# Altium schematic sheet MCU.SchDoc: ESP32 - ANALOG BOARD
size A3; Author: Luca Schenetti; DrawnBy: Luca Schenetti; Engineer: Luca Schenetti; Revision: B; SheetNumber: 2; SheetTotal: 5
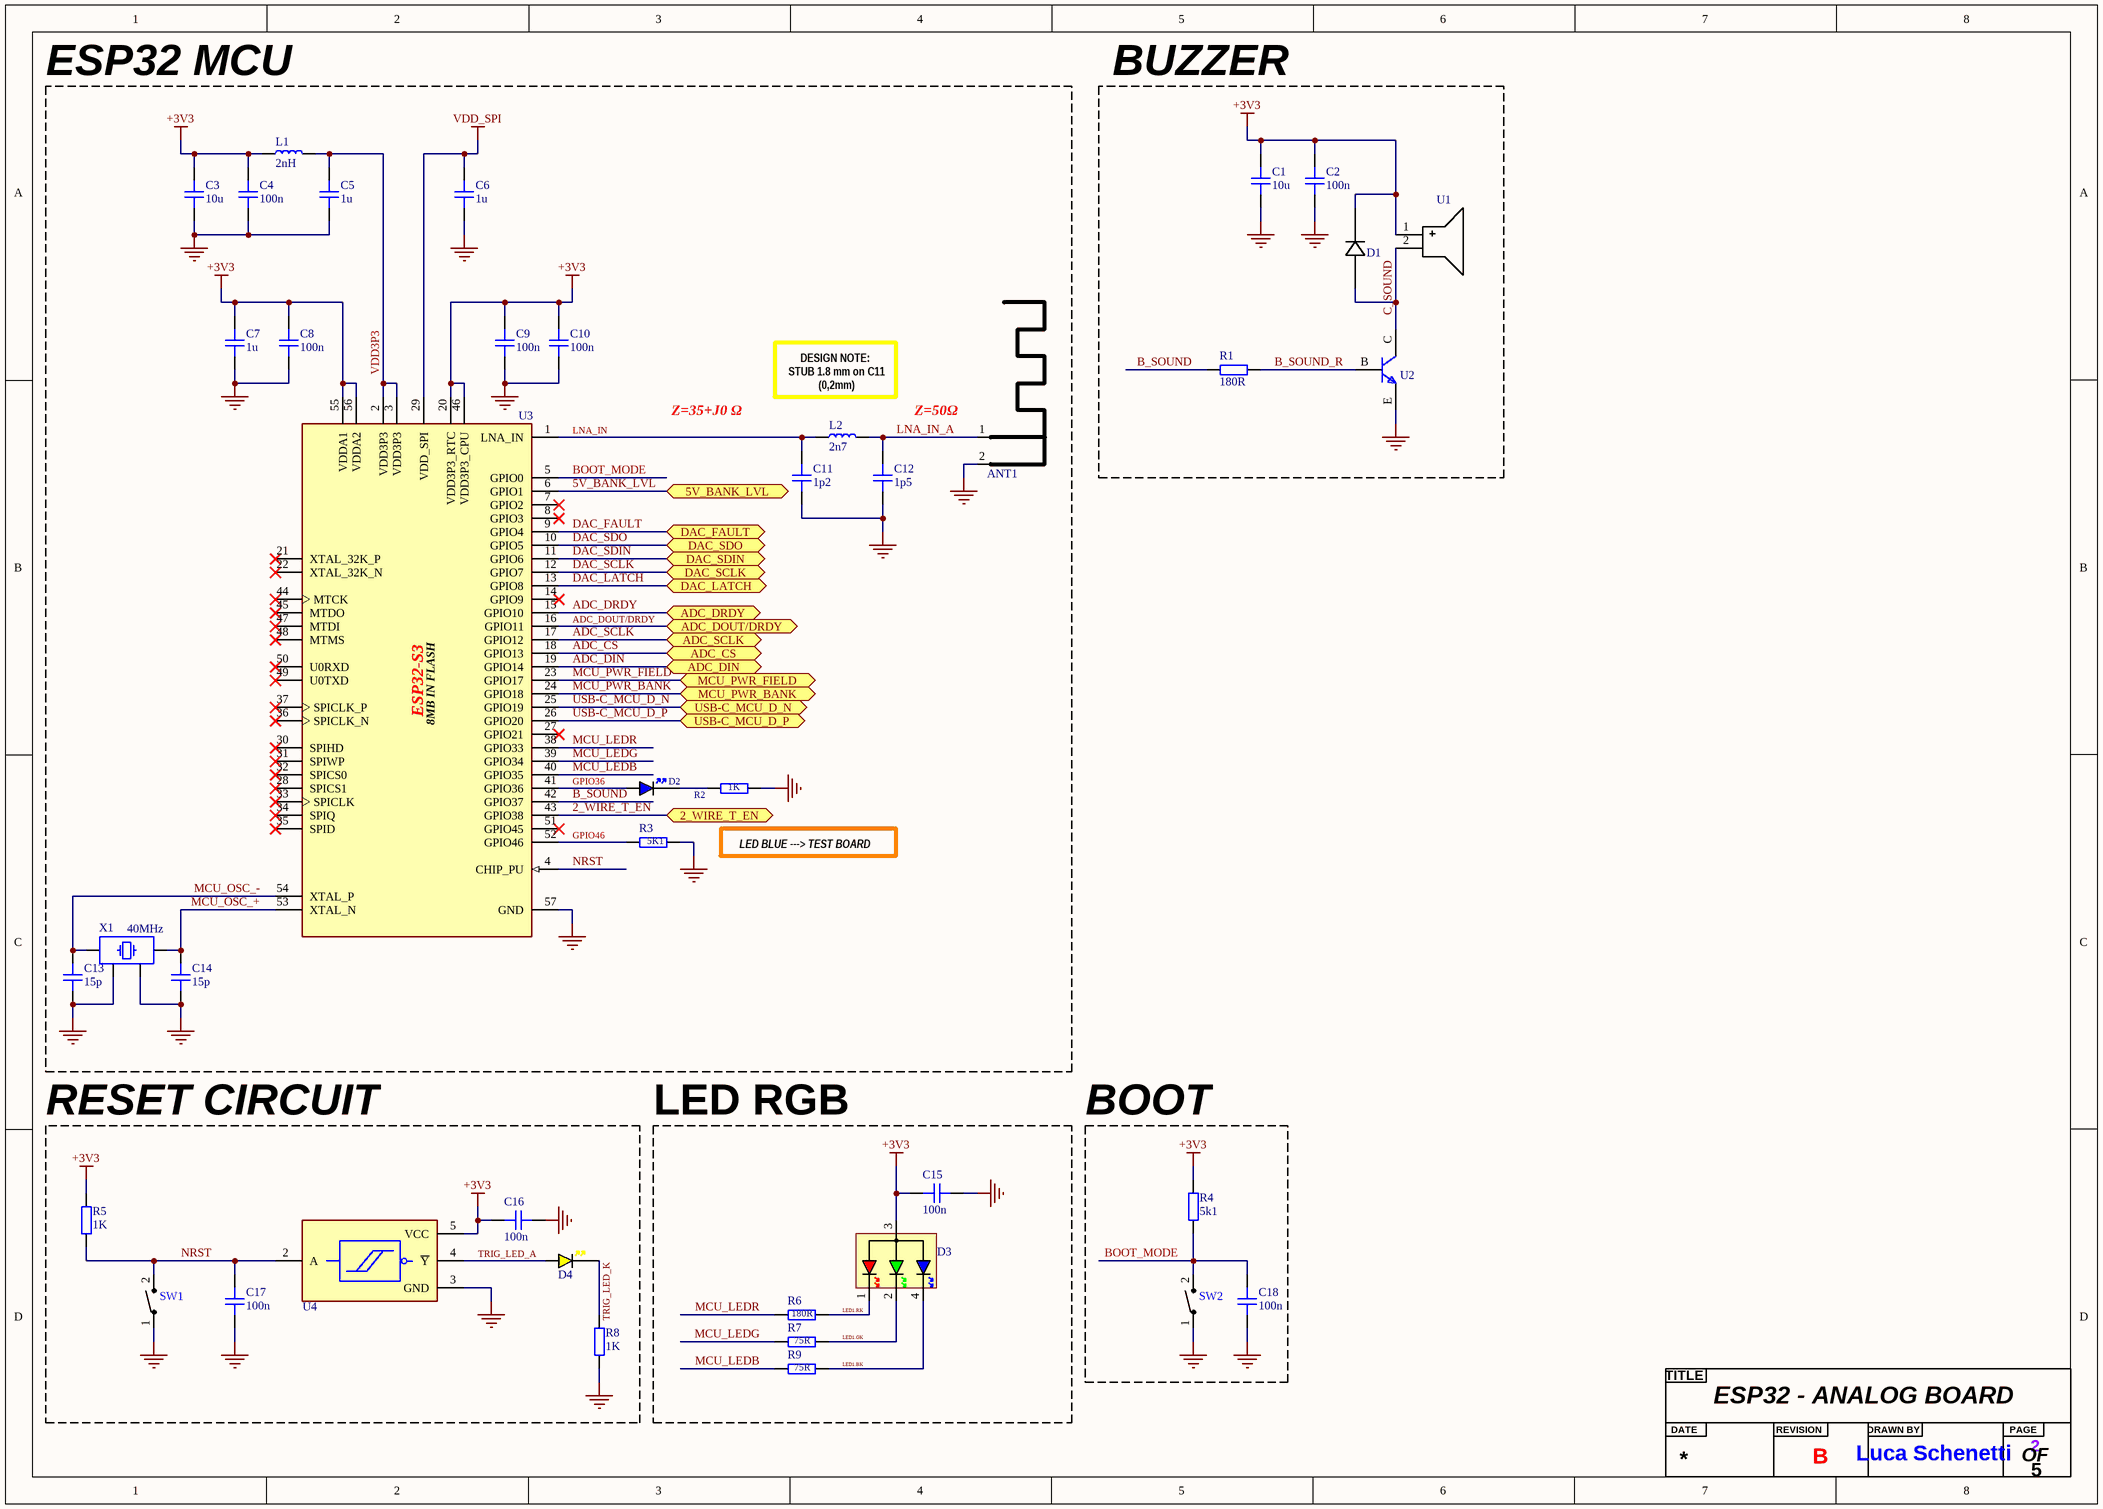
[diagram p0: MCU.SchDoc]

## Parts
?  Title  (value not drawn)  (graphical)
ANT1  PCB Antenna 2.4GHz 50Ohm  [ANT_IFA_USB_2_4GHZ_50R]  (value not drawn)  (no BOM)
C1  10u  [CAP_0402]
C2  100n  [CAP_0402]
C3  10u  [CAP_0402]
C4  100n  [CAP_0402]
C5  1u  [CAP_0402]
C6  1u  [CAP_0402]
C7  1u  [CAP_0402]
C8  100n  [CAP_0402]
C9  100n  [CAP_0402]
C10  100n  [CAP_0402]
C11  1p2  [CAP_0402]
C12  1p5  [CAP_0402]
C13  15p  [CAP_0402]
C14  15p  [CAP_0402]
C15  100n  [CAP_0402]
C16  100n  [CAP_0402]
C17  100n  [CAP_0402]
C18  100n  [CAP_0402]
D1  DIODE 300mA 75V  [1N4148W]  (value not drawn)
D2  BLUE  [LED_0603_BLUE]  (value not drawn)
D3  RGB_LED  [XL-2012RGBC]  (value not drawn)
D4  YELLOW  [LED_0603_YELLOW]  (value not drawn)
L1  2nH  [IND_0402]
L2  2n7  [IND_0402]
R1  180R  [RES_0402]
R2  1K  [RES_0402]
R3  5K1  [RES_0402]
R4  5k1  [RES_0402]
R5  1K  [RES_0402]
R6  180R  [RES_0402]
R7  75R  [RES_0402]
R8  1K  [RES_0402]
R9  75R  [RES_0402]
SW1  TS-1088-AR02016  [TS-1088-AR02016]  (value not drawn)
SW2  TS-1088-AR02016  [TS-1088-AR02016]  (value not drawn)
U1  Passive Buzzer 4kHz  [KLJ-4020]  (value not drawn)
U2  TRANSISTOR NPN  [SS8050]  (value not drawn)
U3  ESP32-S3 8MB IN FLASH  [ESP32-S3FN8]  (value not drawn)
U4  Schmitt Trigger 1.65V~5.5V  [74LVC1G14GW,125]  (value not drawn)
X1  40MHz  [XTAL_3225]

## Blocks framed on the sheet
ESP32 MCU: ANT1 C3-C14 D2 L1 L2 R2 R3 U3 X1
BUZZER: C1 C2 D1 R1 U1 U2
RESET CIRCUIT: C16 C17 D4 R5 R8 SW1 U4
LED RGB: C15 D3 R6 R7 R9
BOOT: C18 R4 SW2

## Ports
2_WIRE_T_EN (bidir, see DAC[6B]), 5V_BANK_LVL (bidir, see PWR RAIL[4C]), ADC_CS (bidir, see ADC[5B]), ADC_DIN (bidir, see ADC[5B]), ADC_DOUT/DRDY (bidir, see ADC[5C]), ADC_DRDY (bidir, see ADC[5C]), ADC_SCLK (bidir, see ADC[5B]), DAC_FAULT (bidir, see DAC[6C]), DAC_LATCH (bidir, see DAC[6B]), DAC_SCLK (bidir, see DAC[6B]), DAC_SDIN (bidir, see DAC[6B]), DAC_SDO (bidir, see DAC[6C]), MCU_PWR_BANK (bidir, see PWR RAIL[6B]), MCU_PWR_FIELD (bidir, see PWR RAIL[6B]), USB-C_MCU_D_N (bidir, see PWR RAIL[3C]), USB-C_MCU_D_P (bidir, see PWR RAIL[3C])

## Nets
+3V3: C1.2 C2.2 C3.2 C4.2 C7.2 C8.2 C9.2 C10.2 C15.2 C16.2 D1.1(C) D3.3(AC) L1.1 R4.2 R5.2 U1.1(+) U3.20(VDD3P3_RTC) U3.46(VDD3P3_CPU) U3.55(VDDA1) U3.56(VDDA2) U4.5(VCC)
GND: ANT1.2(GND) C1.1 C2.1 C3.1 C4.1 C5.1 C6.1 C7.1 C8.1 C9.1 C10.1 C11.1 C12.1 C13.1 C14.1 C15.1 C16.1 C17.1 C18.1 R2.1 R3.1 R8.1 SW1.1 SW2.1 U2.E U3.57(GND) U4.3(GND) X1.2 X1.4
VDD_SPI: C6.2 U3.29(VDD_SPI)
2_WIRE_T_EN: U3.43(GPIO38) ; port 2_WIRE_T_EN
5V_BANK_LVL: U3.6(GPIO1) ; port 5V_BANK_LVL
ADC_CS: U3.18(GPIO13) ; port ADC_CS
ADC_DIN: U3.19(GPIO14) ; port ADC_DIN
ADC_DOUT/DRDY: U3.16(GPIO11) ; port ADC_DOUT/DRDY
ADC_DRDY: U3.15(GPIO10) ; port ADC_DRDY
ADC_SCLK: U3.17(GPIO12) ; port ADC_SCLK
B_SOUND: R1.1 U3.42(GPIO37)
B_SOUND_R: R1.2 U2.B
BOOT_MODE: C18.2 R4.1 SW2.2 U3.5(GPIO0)
C_SOUND: D1.2(A) U1.2(-) U2.C
DAC_FAULT: U3.9(GPIO4) ; port DAC_FAULT
DAC_LATCH: U3.13(GPIO8) ; port DAC_LATCH
DAC_SCLK: U3.12(GPIO7) ; port DAC_SCLK
DAC_SDIN: U3.11(GPIO6) ; port DAC_SDIN
DAC_SDO: U3.10(GPIO5) ; port DAC_SDO
GPIO36: D2.A U3.41(GPIO36)
GPIO46: R3.2 U3.52(GPIO46)
LED1.BK: D3.4(CB) R9.2
LED1.GK: D3.2(CG) R7.2
LED1.RK: D3.1(CR) R6.2
LNA_IN: C11.2 L2.1 U3.1(LNA_IN)
LNA_IN_A: ANT1.1(RF) C12.2 L2.2
MCU_LEDB: R9.1 U3.40(GPIO35)
MCU_LEDG: R7.1 U3.39(GPIO34)
MCU_LEDR: R6.1 U3.38(GPIO33)
MCU_OSC_+: C14.2 U3.53(XTAL_N) X1.1
MCU_OSC_-: C13.2 U3.54(XTAL_P) X1.3
MCU_PWR_BANK: U3.24(GPIO18) ; port MCU_PWR_BANK
MCU_PWR_FIELD: U3.23(GPIO17) ; port MCU_PWR_FIELD
NRST: C17.2 R5.1 SW1.2 U3.4(CHIP_PU) U4.2(A)
TRIG_LED_A: D4.A U4.4(~{Y})
TRIG_LED_K: D4.K R8.2
USB-C_MCU_D_N: U3.25(GPIO19) ; port USB-C_MCU_D_N
USB-C_MCU_D_P: U3.26(GPIO20) ; port USB-C_MCU_D_P
VDD3P3: C5.2 L1.2 U3.2(VDD3P3) U3.3(VDD3P3)
NetD2_K: D2.K R2.2

Not connected (* = marked no-connect by the designer): U3 7(GPIO2)* 8(GPIO3)* 14(GPIO9)* 21(XTAL_32K_P)* 22(XTAL_32K_N)* 27(GPIO21)* 28(SPICS1)* 30(SPIHD)* 31(SPIWP)* 32(SPICS0)* 33(SPICLK)* 34(SPIQ)* 35(SPID)* 36(SPICLK_N)* 37(SPICLK_P)* 44(MTCK)* 45(MTDO)* 47(MTDI)* 48(MTMS)* 49(U0TXD)* 50(U0RXD)* 51(GPIO45)*

## Notes on the sheet
- Z=35+J0 Ω
- (near L2) DESIGN NOTE:
  STUB 1.8 mm on C11
  (0,2mm)
- Z=50Ω
- LED BLUE ---> TEST BOARD
- (in symbol ESP32-S3FN8) ESP32-S3; 8MB IN FLASH
- (in symbol Title) TITLE; DATE; REVISION; DRAWN BY; PAGE; OF

## Library data of the parts
ANT1 = ANT_IFA_USB_2_4GHZ_50R: Inverted F 2.4GHz ISM PCB Antenna 50 Ohm; ComponentLink1Description: Datasheet; ComponentLink1URL: https://www.ti.com/lit/an/swra117d/swra117d.pdf
C1 C3 = CAP_0402: [C15525]; Manufacturer: *; Manufacturer Part Number: *; Distributor Link: *; LCSC: *; Rating: *; Dielectric: *
C2 C4 C8-C10 C15-C18 = CAP_0402: [C307331]; Manufacturer: *; Manufacturer Part Number: *; Distributor Link: *; LCSC: *; Rating: *; Dielectric: *
C5-C7 = CAP_0402: [C52923]; Manufacturer: *; Manufacturer Part Number: *; Distributor Link: *; LCSC: *; Rating: *; Dielectric: *
C11 = CAP_0402: [C76899]; Manufacturer: *; Manufacturer Part Number: *; Distributor Link: *; LCSC: *; Rating: *; Dielectric: *
C12 = CAP_0402: [C76900]; Manufacturer: *; Manufacturer Part Number: *; Distributor Link: *; LCSC: *; Rating: *; Dielectric: *
C13 C14 = CAP_0402: Capacitor SMD 0402 [C1548]; Manufacturer: *; Manufacturer Part Number: *; Distributor Link: *; LCSC: *; Rating: *; Dielectric: *
D1 = 1N4148W: [C917030]
D2 = LED_0603_BLUE: [C965807]
D3 = RGB_LED_0805: [C965848]
D4 = LED_0603_YELLOW: [C89811]
L1 = IND_0402: [C18216]
L2 = IND_0402: [C77108]
R1 R6 = RES_0402: [C138045]; Manufacturer: *; Manufacturer Part Number: *; Distributor Link: *; LCSC: *
R2 R5 R8 = RES_0402: [C11702]; Manufacturer: *; Manufacturer Part Number: *; Distributor Link: *; LCSC: *
R3 R4 = RES_0402: [C25905]; Manufacturer: *; Manufacturer Part Number: *; Distributor Link: *; LCSC: *
R7 R9 = RES_0402: [C25133]; Manufacturer: *; Manufacturer Part Number: *; Distributor Link: *; LCSC: *
SW1 SW2 = TS-1088-AR02016: [C720477]; Manufacturer: XUNPU(讯普); Add into BOM: yes; Circuit: SPST; Actuator Style: Round Button; Operating Force: 160gf; Switch Length: 4mm; Switch Width: 3mm; Switch Height: 2mm; Strike Gundam: 不带; Contact Current: 50mA; Voltage Rating (DC): 12V; Insulation Resistance: 100MΩ; Actuator/Cap Color: Black; Pin Style: SMDSplicing; Mechanical Life: 10万次; Symbol: TS-1088-AR02016; Device: TS-1088-AR02016; Supplier: LCSC; Supplier Part: C720477; Manufacturer Part: TS-1088-AR02016; JLCPCB Part Class: Extended Part; LCSC Part Name: 4*3*2mm 立贴 轻触开关; Supplier Footprint: SMD; Datasheet: https://atta.szlcsc.com/upload/public/pdf/source/20200810/C720475_60D09DD6C54279ADDB2DC25100F1CC11.pdf; Convert to PCB: yes; Mounting Style: Brick nogging; Operating Temperature: -30℃~+80℃
U1 = KLJ-4020: [C556936]
U2 = SS8050: [C2150]
U3 = ESP32-S3FN8: [C2913196]
U4 = 74LVC1G14GW,125: [C265125]
X1 = TSX-3225_24.0000MF15X-AC: [C5261245]; Manufacturer: Epson; Manufacturer Part Number: TSX-3225 24.0000MF15X-AC